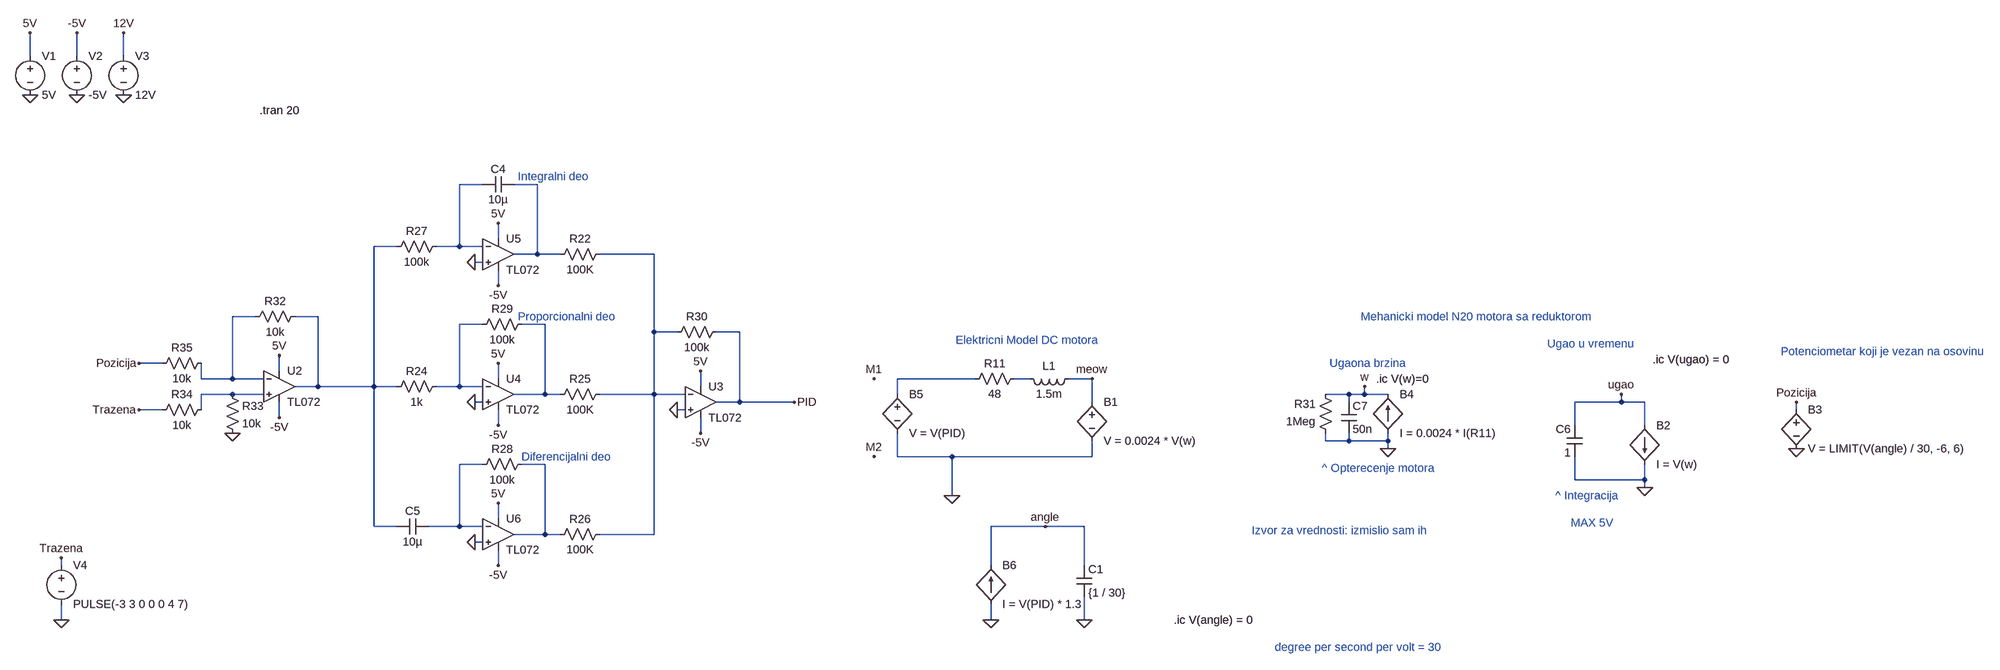
[diagram p0: schematic simplified.asc]
simplified.asc, the LTspice schematic file:
Version 4
SHEET 1 6380 2180
WIRE -1152 -816 -1152 -864
WIRE -1056 -816 -1056 -864
WIRE -960 -816 -960 -864
WIRE -80 448 -128 448
WIRE 32 448 -16 448
WIRE -48 560 -48 528
WIRE -256 576 -304 576
WIRE -128 576 -128 448
WIRE -128 576 -176 576
WIRE -80 576 -128 576
WIRE 32 592 32 448
WIRE 32 592 -16 592
WIRE 80 592 32 592
WIRE 272 592 160 592
WIRE -80 608 -96 608
WIRE -48 656 -48 624
WIRE -688 720 -736 720
WIRE -560 720 -608 720
WIRE -80 736 -128 736
WIRE 48 736 0 736
WIRE 272 752 272 592
WIRE 320 752 272 752
WIRE 448 752 400 752
WIRE -880 816 -928 816
WIRE -640 832 -640 800
WIRE -800 848 -800 816
WIRE -736 848 -736 720
WIRE -736 848 -800 848
WIRE -672 848 -736 848
WIRE -48 848 -48 816
WIRE 1184 848 1024 848
WIRE 1296 848 1264 848
WIRE 1424 848 1376 848
WIRE -560 864 -560 720
WIRE -560 864 -608 864
WIRE -304 864 -304 576
WIRE -304 864 -560 864
WIRE -256 864 -304 864
WIRE -128 864 -128 736
WIRE -128 864 -176 864
WIRE -80 864 -128 864
WIRE 368 864 368 832
WIRE -736 880 -800 880
WIRE -672 880 -736 880
WIRE 48 880 48 736
WIRE 48 880 -16 880
WIRE 80 880 48 880
WIRE 272 880 272 752
WIRE 272 880 160 880
WIRE 336 880 272 880
WIRE 1024 880 1024 848
WIRE 1952 880 1904 880
WIRE 1984 880 1984 864
WIRE 1984 880 1952 880
WIRE 2032 880 1984 880
WIRE -80 896 -96 896
WIRE 448 896 448 752
WIRE 448 896 400 896
WIRE 560 896 448 896
WIRE 1424 896 1424 848
WIRE 1952 896 1952 880
WIRE 2512 896 2512 880
WIRE 2512 896 2416 896
WIRE 2560 896 2512 896
WIRE -880 912 -928 912
WIRE -800 912 -800 880
WIRE 336 912 320 912
WIRE 2880 912 2880 896
WIRE -640 928 -640 896
WIRE -48 944 -48 912
WIRE 2416 944 2416 896
WIRE 2560 944 2560 896
WIRE 368 960 368 928
WIRE 1904 976 1904 960
WIRE 1952 976 1952 960
WIRE 1952 976 1904 976
WIRE 2032 976 2032 960
WIRE 2032 976 1952 976
WIRE 2032 992 2032 976
WIRE 1024 1008 1024 960
WIRE 1136 1008 1024 1008
WIRE 1424 1008 1424 976
WIRE 1424 1008 1136 1008
WIRE -80 1024 -128 1024
WIRE 48 1024 0 1024
WIRE 2416 1056 2416 1008
WIRE 2560 1056 2560 1024
WIRE 2560 1056 2416 1056
WIRE 2560 1072 2560 1056
WIRE 1136 1088 1136 1008
WIRE -48 1136 -48 1104
WIRE -304 1152 -304 864
WIRE -256 1152 -304 1152
WIRE -128 1152 -128 1024
WIRE -128 1152 -192 1152
WIRE -80 1152 -128 1152
WIRE 1328 1152 1216 1152
WIRE 1408 1152 1328 1152
WIRE 48 1168 48 1024
WIRE 48 1168 -16 1168
WIRE 80 1168 48 1168
WIRE 272 1168 272 880
WIRE 272 1168 160 1168
WIRE -80 1184 -96 1184
WIRE -1088 1232 -1088 1216
WIRE -48 1232 -48 1200
WIRE 1216 1232 1216 1152
WIRE 1408 1232 1408 1152
WIRE -1088 1344 -1088 1312
WIRE 1216 1344 1216 1312
WIRE 1408 1344 1408 1296
FLAG -1152 -736 0
FLAG -1152 -864 5V
FLAG -1056 -736 0
FLAG -1056 -864 -5V
FLAG -960 -736 0
FLAG -960 -864 12V
FLAG 560 896 PID
FLAG 976 1008 M2
FLAG 976 848 M1
FLAG 1424 848 meow
FLAG 2032 992 0
FLAG 1984 864 w
FLAG 2560 1072 0
FLAG 2512 880 ugao
FLAG 2880 992 0
FLAG 2880 896 Pozicija
FLAG -1088 1344 0
FLAG -1088 1216 Trazena
FLAG -928 912 Trazena
FLAG -928 816 Pozicija
FLAG -736 960 0
FLAG -640 928 -5V
FLAG -640 800 5V
FLAG -48 656 -5V
FLAG -48 528 5V
FLAG 368 960 -5V
FLAG 368 832 5V
FLAG -48 944 -5V
FLAG -48 816 5V
FLAG -48 1232 -5V
FLAG -48 1104 5V
FLAG -96 896 0
FLAG -96 608 0
FLAG -96 1184 0
FLAG 320 912 0
FLAG 1136 1088 0
FLAG 1216 1344 0
FLAG 1408 1344 0
FLAG 1328 1152 angle
SYMBOL voltage -1152 -832 R0
WINDOW 123 0 0 Left 0
WINDOW 39 0 0 Left 0
SYMATTR InstName V1
SYMATTR Value 5V
SYMBOL voltage -1056 -832 R0
WINDOW 123 0 0 Left 0
WINDOW 39 0 0 Left 0
SYMATTR InstName V2
SYMATTR Value -5V
SYMBOL voltage -960 -832 R0
WINDOW 123 0 0 Left 0
WINDOW 39 0 0 Left 0
SYMATTR InstName V3
SYMATTR Value 12V
SYMBOL res 1280 832 R90
WINDOW 0 0 56 VBottom 2
WINDOW 3 32 56 VTop 2
SYMATTR InstName R11
SYMATTR Value 48
SYMBOL ind 1392 832 R90
WINDOW 0 5 56 VBottom 2
WINDOW 3 32 56 VTop 2
SYMATTR InstName L1
SYMATTR Value 1.5m
SYMATTR SpiceLine Rser=1m
SYMBOL res 176 576 R90
WINDOW 0 0 56 VBottom 2
WINDOW 3 32 56 VTop 2
SYMATTR InstName R22
SYMATTR Value 100K
SYMBOL res 176 864 R90
WINDOW 0 0 56 VBottom 2
WINDOW 3 32 56 VTop 2
SYMATTR InstName R25
SYMATTR Value 100K
SYMBOL res 176 1152 R90
WINDOW 0 0 56 VBottom 2
WINDOW 3 32 56 VTop 2
SYMATTR InstName R26
SYMATTR Value 100K
SYMBOL res -160 560 R90
WINDOW 0 0 56 VBottom 2
WINDOW 3 32 56 VTop 2
SYMATTR InstName R27
SYMATTR Value 100k
SYMBOL res -160 848 R90
WINDOW 0 0 56 VBottom 2
WINDOW 3 32 56 VTop 2
SYMATTR InstName R24
SYMATTR Value 1k
SYMBOL res 16 1008 R90
WINDOW 0 0 56 VBottom 2
WINDOW 3 32 56 VTop 2
SYMATTR InstName R28
SYMATTR Value 100k
SYMBOL cap -16 432 R90
WINDOW 0 0 32 VBottom 2
WINDOW 3 32 32 VTop 2
SYMATTR InstName C4
SYMATTR Value 10µ
SYMBOL cap -192 1136 R90
WINDOW 0 0 32 VBottom 2
WINDOW 3 32 32 VTop 2
SYMATTR InstName C5
SYMATTR Value 10µ
SYMBOL res 16 720 R90
WINDOW 0 0 56 VBottom 2
WINDOW 3 32 56 VTop 2
SYMATTR InstName R29
SYMATTR Value 100k
SYMBOL res 416 736 R90
WINDOW 0 0 56 VBottom 2
WINDOW 3 32 56 VTop 2
SYMATTR InstName R30
SYMATTR Value 100k
SYMBOL bv 1424 880 R0
SYMATTR InstName B1
SYMATTR Value V = 0.0024 * V(w)
SYMBOL bi 2032 960 M180
WINDOW 0 24 80 Left 2
WINDOW 3 24 0 Left 2
SYMATTR InstName B4
SYMATTR Value I = 0.0024 * I(R11)
SYMBOL bi 2560 944 R0
SYMATTR InstName B2
SYMATTR Value I = V(w)
SYMBOL cap 2432 944 M0
SYMATTR InstName C6
SYMATTR Value 1
SYMBOL cap 1936 896 R0
SYMATTR InstName C7
SYMATTR Value 50n
SYMBOL res 1920 976 R180
WINDOW 0 36 76 Left 2
WINDOW 3 36 40 Left 2
SYMATTR InstName R31
SYMATTR Value 1Meg
SYMBOL bv 2880 896 R0
SYMATTR InstName B3
SYMATTR Value V = LIMIT(V(angle) / 30, -6, 6)
SYMBOL res -592 704 R90
WINDOW 0 0 56 VBottom 2
WINDOW 3 32 56 VTop 2
SYMATTR InstName R32
SYMATTR Value 10k
SYMBOL res -752 864 R0
SYMATTR InstName R33
SYMATTR Value 10k
SYMBOL res -784 896 R90
WINDOW 0 0 56 VBottom 2
WINDOW 3 32 56 VTop 2
SYMATTR InstName R34
SYMATTR Value 10k
SYMBOL res -784 800 R90
WINDOW 0 0 56 VBottom 2
WINDOW 3 32 56 VTop 2
SYMATTR InstName R35
SYMATTR Value 10k
SYMBOL bv 1024 864 R0
SYMATTR InstName B5
SYMATTR Value V = V(PID)
SYMBOL ZZZ\\OpAmp\\TL072 -640 864 R0
SYMATTR InstName U2
SYMBOL ZZZ\\OpAmp\\TL072 368 896 R0
SYMATTR InstName U3
SYMBOL ZZZ\\OpAmp\\TL072 -48 880 R0
SYMATTR InstName U4
SYMBOL ZZZ\\OpAmp\\TL072 -48 592 R0
SYMATTR InstName U5
SYMBOL ZZZ\\OpAmp\\TL072 -48 1168 R0
SYMATTR InstName U6
SYMBOL bi 1216 1312 M180
WINDOW 0 24 80 Left 2
WINDOW 3 24 0 Left 2
SYMATTR InstName B6
SYMATTR Value I = V(PID) * 1.3
SYMBOL cap 1392 1232 R0
SYMATTR InstName C1
SYMATTR Value {1 / 30}
SYMBOL voltage -1088 1216 R0
WINDOW 123 0 0 Left 0
WINDOW 39 0 0 Left 0
SYMATTR InstName V4
SYMATTR Value PULSE(-3 3 0 0 0 4 7)
TEXT -680 -704 Left 2 !.tran 20
TEXT -8 432 Left 2 ;Integralni deo
TEXT -8 720 Left 2 ;Proporcionalni deo
TEXT 0 1008 Left 2 ;Diferencijalni deo
TEXT 1144 768 Left 2 ;Elektricni Model DC motora
TEXT 2576 808 Left 2 !.ic V(ugao) = 0
TEXT 1912 816 Left 2 ;Ugaona brzina
TEXT 1896 1032 Left 2 ;^ Opterecenje motora
TEXT 2360 776 Left 2 ;Ugao u vremenu
TEXT 2376 1088 Left 2 ;^ Integracija
TEXT 2008 848 Left 2 !.ic V(w)=0
TEXT 1976 720 Left 2 ;Mehanicki model N20 motora sa reduktorom
TEXT 1752 1160 Left 2 ;Izvor za vrednosti: izmislio sam ih
TEXT 2848 792 Left 2 ;Potenciometar koji je vezan na osovinu
TEXT 2408 1144 Left 2 ;MAX 5V
TEXT 1592 1344 Left 2 !.ic V(angle) = 0
TEXT 1800 1400 Left 2 ;degree per second per volt = 30

The netlist it stands for:
* simplified.asc
V1 5V 0 5V
V2 -5V 0 -5V
V3 12V 0 12V
R11 N009 N008 48
L1 meow N009 1.5m Rser=1m
R22 N004 N002 100K
R25 N004 N007 100K
R26 N004 N012 100K
R27 N001 N003 100k
R24 N006 N003 1k
R28 N012 N011 100k
C4 N002 N001 10µ
C5 N011 N003 10µ
R29 N007 N006 100k
R30 PID N004 100k
B1 meow 0 V = 0.0024 * V(w)
B4 0 w I = 0.0024 * I(R11)
B2 ugao 0 I = V(w)
C6 ugao 0 1
C7 w 0 50n
R31 0 w 1Meg
B3 Pozicija 0 V = LIMIT(V(angle) / 30, -6, 6)
R32 N003 N005 10k
R33 N010 0 10k
R34 N010 Trazena 10k
R35 N005 Pozicija 10k
B5 N008 0 V = V(PID)
* U2: TL072 (symbol ZZZ\OpAmp\TL072 not available, pins judged from their places): In+=N010 In-=N005 V+=5V V-=-5V OUT=N003
* U3: TL072 (symbol ZZZ\OpAmp\TL072 not available, pins judged from their places): In+=0 In-=N004 V+=5V V-=-5V OUT=PID
* U4: TL072 (symbol ZZZ\OpAmp\TL072 not available, pins judged from their places): In+=0 In-=N006 V+=5V V-=-5V OUT=N007
* U5: TL072 (symbol ZZZ\OpAmp\TL072 not available, pins judged from their places): In+=0 In-=N001 V+=5V V-=-5V OUT=N002
* U6: TL072 (symbol ZZZ\OpAmp\TL072 not available, pins judged from their places): In+=0 In-=N011 V+=5V V-=-5V OUT=N012
B6 0 angle I = V(PID) * 1.3
C1 angle 0 {1 / 30}
V4 Trazena 0 PULSE(-3 3 0 0 0 4 7)
.tran 20
* Integralni deo
* Proporcionalni deo
* Diferencijalni deo
* Elektricni Model DC motora
.ic V(ugao) = 0
* Ugaona brzina
* ^ Opterecenje motora
* Ugao u vremenu
* ^ Integracija
.ic V(w)=0
* Mehanicki model N20 motora sa reduktorom
* Izvor za vrednosti: izmislio sam ih
* Potenciometar koji je vezan na osovinu
* MAX 5V
.ic V(angle) = 0
* degree per second per volt = 30
.backanno
.end